# EAGLE design mbc_89_22_03_01 (EAGLE 7.6.0)

## Sheet 1 of 3
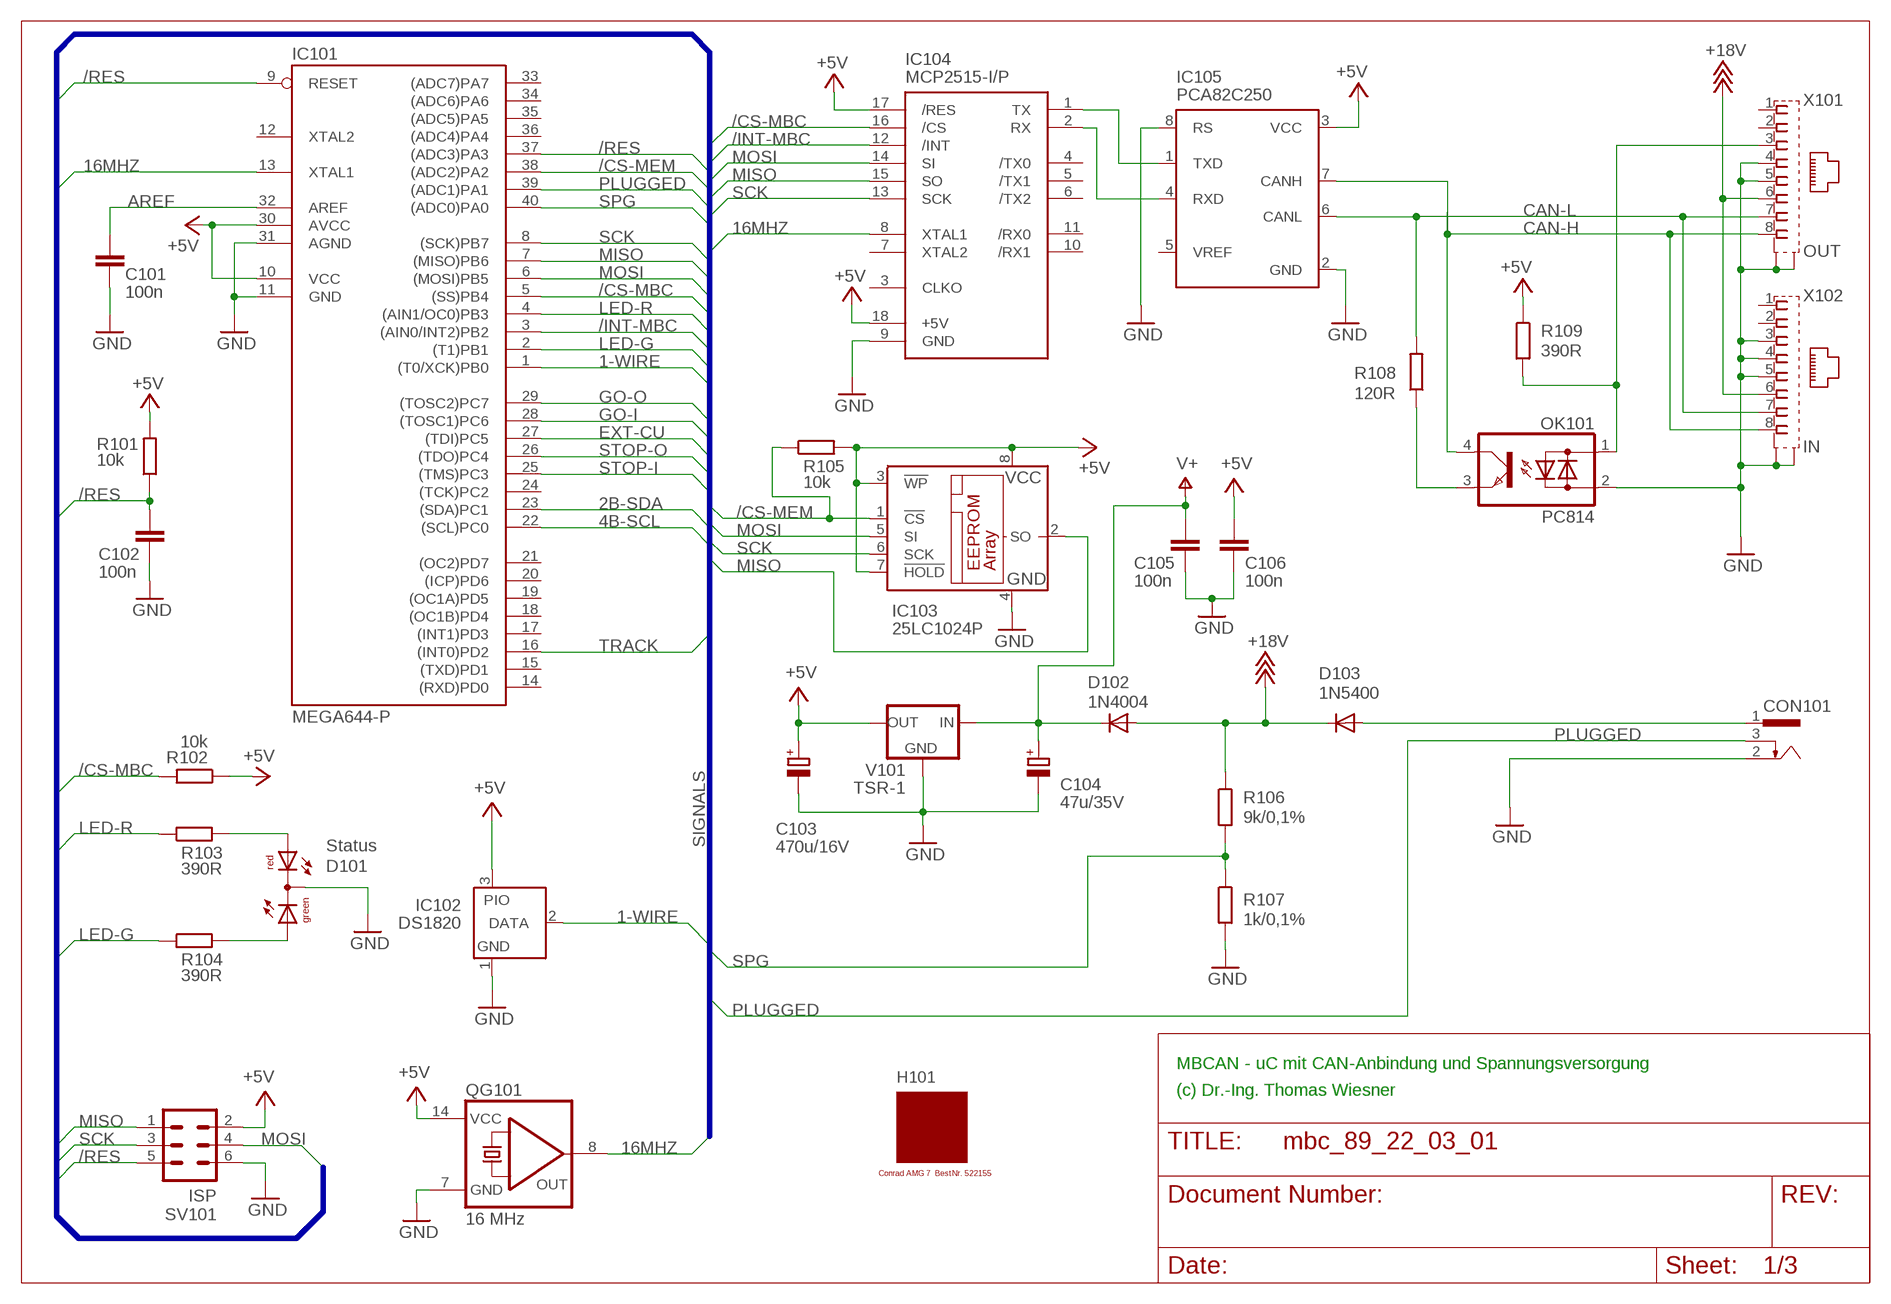
[diagram p0: schematic, sheet 1]

### Parts
C101  100n  C-EU025-025X050  [C025-025X050]
C102  100n  C-EU025-025X050  [C025-025X050]
C103  470u/16V  CPOL-EUE3.5-8  [E3,5-8]
C104  47u/35V  CPOL-EUE2.5-7  [E2,5-7]
C105  100n  C-EU025-025X050  [C025-025X050]
C106  100n  C-EU025-025X050  [C025-025X050]
CON101  POWER-JACK  [POWER-JACK]
D101  Status  DUOLED5MM  [DUOLED5MM]
D102  1N4004  [DO41-10]
D103  1N5400  [DO201-15]
H101  MODULGEHÄUSE-AMG-7  [MODULGEHÄUSE-1]
IC101  MEGA644-P  MEGA323-P  [DIL40]
IC102  DS1820  DS2405  [TO92-]
IC103  25LC1024P  25LC040P  [DIL8]
IC104  MCP2515-I/P  MCP2510-I/P  [DIL18]
IC105  PCA82C250  [DIL08]
OK101  PC814  [DIL04]
QG101  16 MHz  QG5860  [DIL14S]
R101  10k  R-EU_0207/10  [0207/10]
R102  10k  R-EU_0207/10  [0207/10]
R103  390R  R-EU_0207/10  [0207/10]
R104  390R  R-EU_0207/10  [0207/10]
R105  10k  R-EU_0207/10  [0207/10]
R106  9k/0,1%  R-EU_0207/10  [0207/10]
R107  1k/0,1%  R-EU_0207/10  [0207/10]
R108  120R  R-EU_0207/10  [0207/10]
R109  390R  R-EU_0207/10  [0207/10]
SV101  ISP  ML6  [ML6]
V101  TSR-1  [TRACO-TSR-1]
X101  OUT  0446200002  [0446200002]
X102  IN  0446200002  [0446200002]

### Nets
1-WIRE: IC101.1((T0/XCK)PB0) IC102.2(DATA)
2B-SDA: IC101.23((SDA)PC1) ; also sheet 2
4B-SCL: IC101.22((SCL)PC0) ; also sheet 2
16MHZ: IC101.13(XTAL1) IC104.8(XTAL1) QG101.8(OUT)
+5V: C103.+ C106.1 IC101.10(VCC) IC101.30(AVCC) IC102.3(PIO) IC103.3(!WP) IC103.7(!HOLD) IC103.8(VCC) IC104.17(/RES) IC104.18(+5V) IC105.3(VCC) QG101.14(VCC) R101.2 R102.1 R105.2 R109.1 SV101.2 V101.OUT ; also sheet 2
+18V: D102.A D103.C R106.1 X101.6 X102.6
/CS-MBC: IC101.5((SS)PB4) IC104.16(/CS) R102.2
/CS-MEM: IC101.38((ADC2)PA2) IC103.1(!CS) R105.1
/INT-MBC: IC101.3((AIN0/INT2)PB2) IC104.12(/INT)
/RES: C102.1 IC101.9(RESET) IC101.37((ADC3)PA3) R101.1 SV101.5
AREF: C101.1 IC101.32(AREF)
CAN-H: IC105.7(CANH) OK101.4(C) X101.8 X102.8
CAN-L: IC105.6(CANL) R108.2 X101.7 X102.7
EXT-CU: IC101.27((TDI)PC5) ; also sheet 2
GND: C101.2 C102.2 C103.- C104.- C105.2 C106.2 CON101.2 D101.K(C) IC101.11(GND) IC101.31(AGND) IC102.1(GND) IC103.4(GND) IC104.9(GND) IC105.2(GND) IC105.8(RS) OK101.2(AC2) QG101.7(GND) R107.2 SV101.6 V101.GND X101.4 X101.5 X101.S@1(S1) X101.S@2(S2) X102.3 X102.4 X102.5 X102.S@1(S1) X102.S@2(S2) ; also sheet 2
GO-I: IC101.28((TOSC1)PC6) ; also sheet 2
GO-O: IC101.29((TOSC2)PC7) ; also sheet 2
LED-G: IC101.2((T1)PB1) R104.1
LED-R: IC101.4((AIN1/OC0)PB3) R103.1
MISO: IC101.7((MISO)PB6) IC103.2(SO) IC104.15(SO) SV101.1
MOSI: IC101.6((MOSI)PB5) IC103.5(SI) IC104.14(SI) SV101.4
N$1: IC104.1(TX) IC105.1(TXD)
N$2: IC104.2(RX) IC105.4(RXD)
N$5: OK101.3(E) R108.1
N$9: D101.AR R103.2
N$11: OK101.1(AC1) R109.2 X101.3
N$13: D101.AG R104.2
PLUGGED: CON101.3 IC101.39((ADC1)PA1)
SCK: IC101.8((SCK)PB7) IC103.6(SCK) IC104.13(SCK) SV101.3
SPG: IC101.40((ADC0)PA0) R106.2 R107.1
STOP-I: IC101.25((TMS)PC3) ; also sheet 2
STOP-O: IC101.26((TDO)PC4) ; also sheet 2
TRACK: IC101.16((INT0)PD2) ; also sheet 2
V+: C104.+ C105.1 D102.C V101.IN ; also sheet 2
V-NETZTEIL: CON101.1 D103.A
Unconnected: IC101.12(XTAL2) IC101.14((RXD)PD0) IC101.15((TXD)PD1) IC101.17((INT1)PD3) IC101.18((OC1B)PD4) IC101.19((OC1A)PD5) IC101.20((ICP)PD6) IC101.21((OC2)PD7) IC101.24((TCK)PC2) IC101.33((ADC7)PA7) IC101.34((ADC6)PA6) IC101.35((ADC5)PA5) IC101.36((ADC4)PA4) IC104.3(CLKO) IC104.4(/TX0) IC104.5(/TX1) IC104.6(/TX2) IC104.7(XTAL2) IC104.10(/RX1) IC104.11(/RX0) IC105.5(VREF) X101.1 X101.2 X102.1 X102.2

### Buses
SIGNALS

### Notes on the sheet
- MBCAN - uC mit CAN-Anbindung und Spannungsversorgung
- (c) Dr.-Ing. Thomas Wiesner

## Sheet 2 of 3
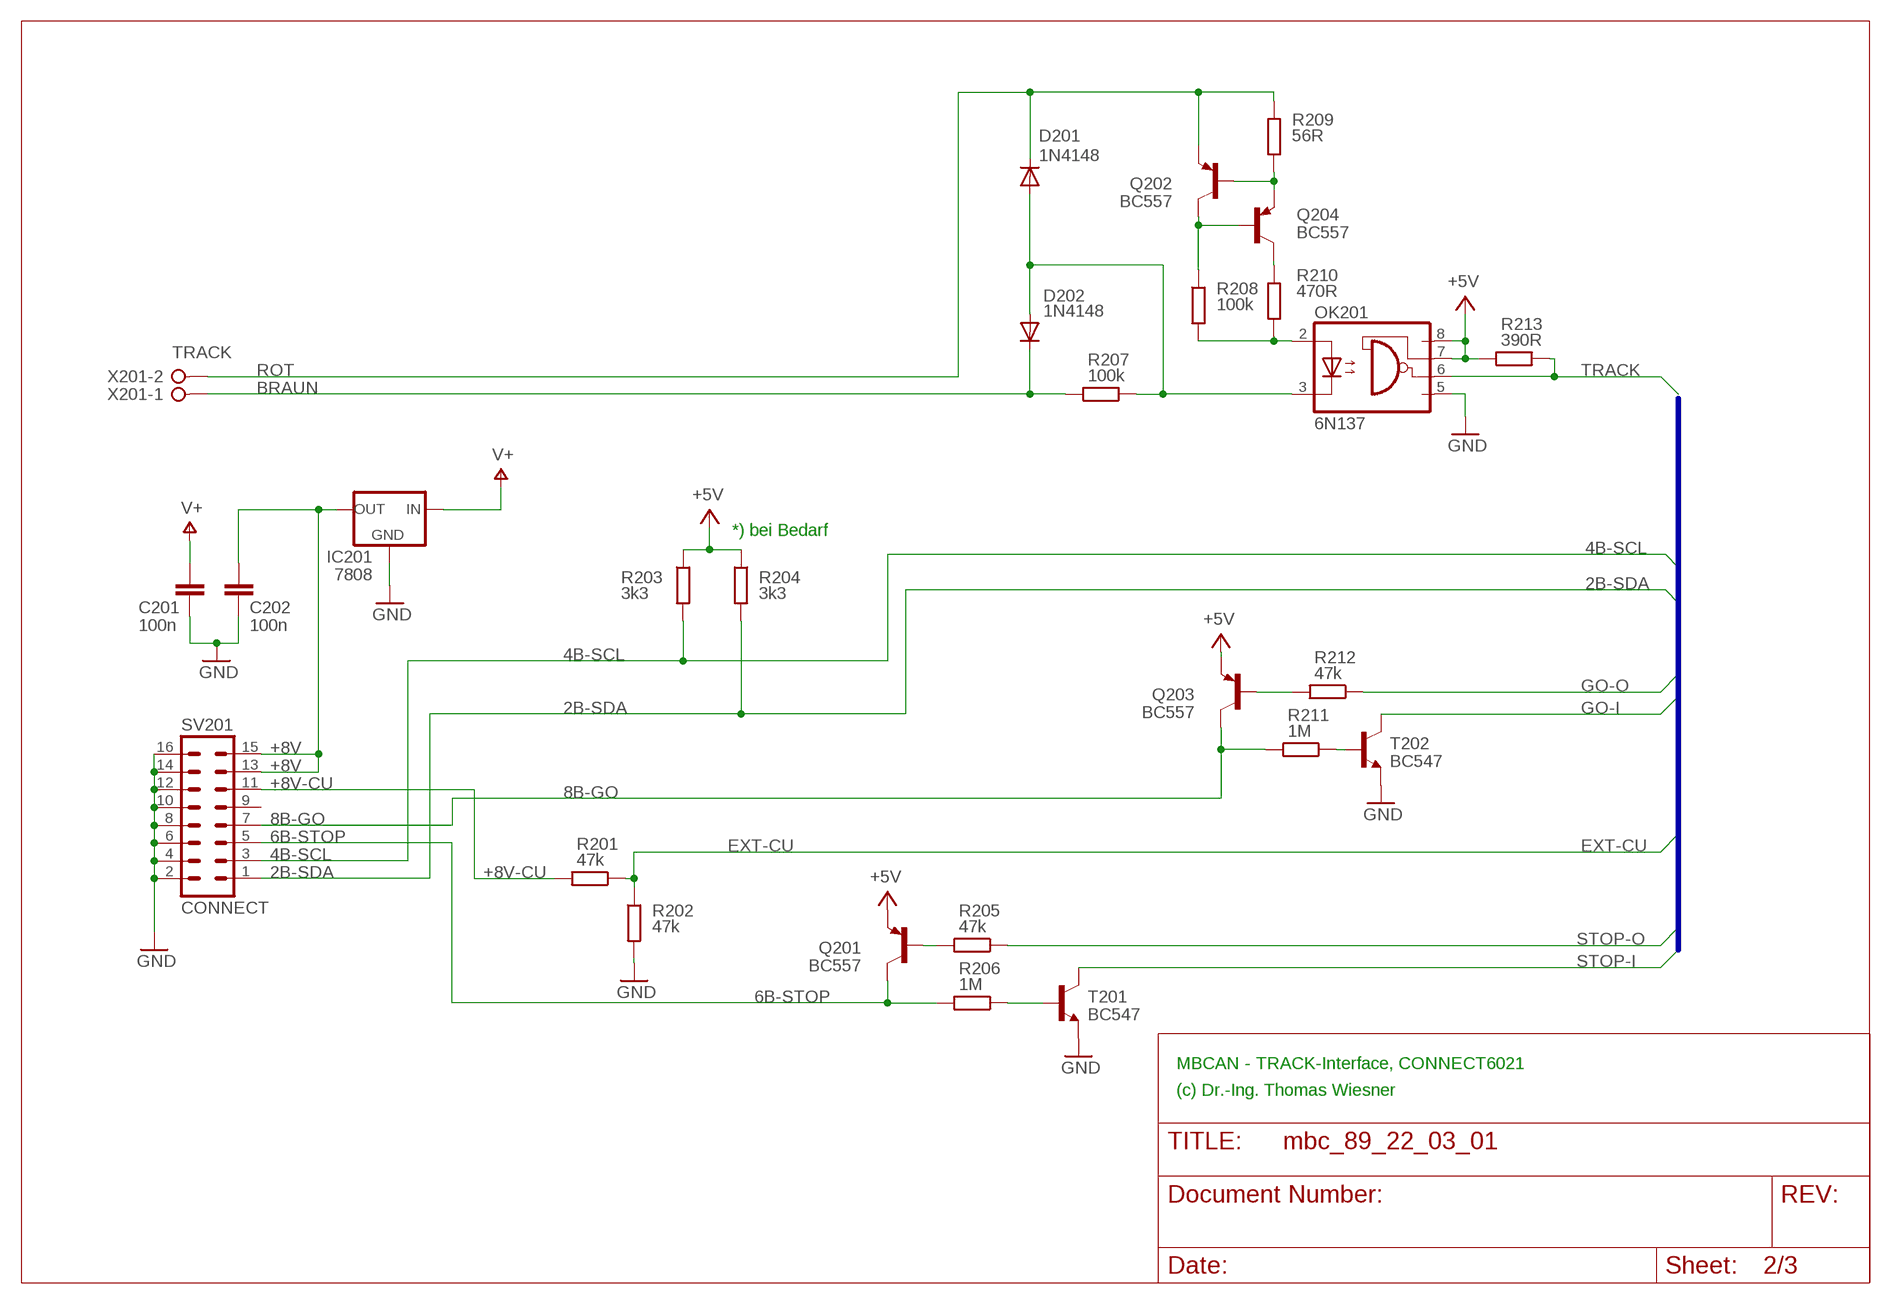
[diagram p1: schematic, sheet 2]

### Parts
C201  100n  C-EU025-025X050  [C025-025X050]
C202  100n  C-EU025-025X050  [C025-025X050]
D201  1N4148  1N4148DO35-10  [DO35-10]
D202  1N4148  1N4148DO35-10  [DO35-10]
IC201  7808  78XXL  [78XXL]
OK201  6N137  [DIL08]
Q201  BC557  [TO92]
Q202  BC557  [TO92]
Q203  BC557  [TO92]
Q204  BC557  [TO92]
R201  47k  R-EU_0207/10  [0207/10]
R202  47k  R-EU_0207/10  [0207/10]
R203  3k3  R-EU_0207/10  [0207/10]
R204  3k3  R-EU_0207/10  [0207/10]
R205  47k  R-EU_0207/10  [0207/10]
R206  1M  R-EU_0207/10  [0207/10]
R207  100k  R-EU_0207/10  [0207/10]
R208  100k  R-EU_0207/10  [0207/10]
R209  56R  R-EU_0207/10  [0207/10]
R210  470R  R-EU_0207/10  [0207/10]
R211  1M  R-EU_0207/10  [0207/10]
R212  47k  R-EU_0207/10  [0207/10]
R213  390R  R-EU_0207/10  [0207/10]
SV201  CONNECT  ML16  [ML16]
T201  BC547  [TO92]
T202  BC547  [TO92]
X201  TRACK  W237-02P  [W237-132]

### Nets
2B-SDA: R204.2 SV201.1 ; also sheet 1
4B-SCL: R203.2 SV201.3 ; also sheet 1
6B-STOP: Q201.3(C) R206.2 SV201.5
8B-GO: Q203.3(C) R211.2 SV201.7
+5V: OK201.7(VE) OK201.8(VCC) Q201.1(E) Q203.1(E) R203.1 R204.1 R213.1 ; also sheet 1
+8V: C202.1 IC201.OUT SV201.13 SV201.15
+8V-CU: R201.2 SV201.11
BRAUN: D202.C R207.2 X201.1
EXT-CU: R201.1 R202.1 ; also sheet 1
GND: C201.2 C202.2 IC201.GND OK201.5(GND) R202.2 SV201.2 SV201.4 SV201.6 SV201.8 SV201.10 SV201.12 SV201.14 SV201.16 T201.1(E) T202.1(E) ; also sheet 1
GO-I: T202.3(C) ; also sheet 1
GO-O: R212.1 ; also sheet 1
N$3: R206.1 T201.2(B)
N$4: Q201.2(B) R205.2
N$7: R211.1 T202.2(B)
N$12: Q203.2(B) R212.2
N$43: D201.A D202.A OK201.3(C) R207.1
N$53: Q202.2(B) Q204.1(E) R209.2
N$54: Q202.3(C) Q204.2(B) R208.1
N$56: Q204.3(C) R210.1
N$57: OK201.2(A) R208.2 R210.2
ROT: D201.C Q202.1(E) R209.1 X201.2
STOP-I: T201.3(C) ; also sheet 1
STOP-O: R205.1 ; also sheet 1
TRACK: OK201.6(VO) R213.2 ; also sheet 1
V+: C201.1 IC201.IN ; also sheet 1
Unconnected: SV201.9

### Buses
B$1
SIGNALS

### Notes on the sheet
- *) bei Bedarf
- MBCAN - TRACK-Interface, CONNECT6021
- (c) Dr.-Ing. Thomas Wiesner

## Sheet 3 of 3
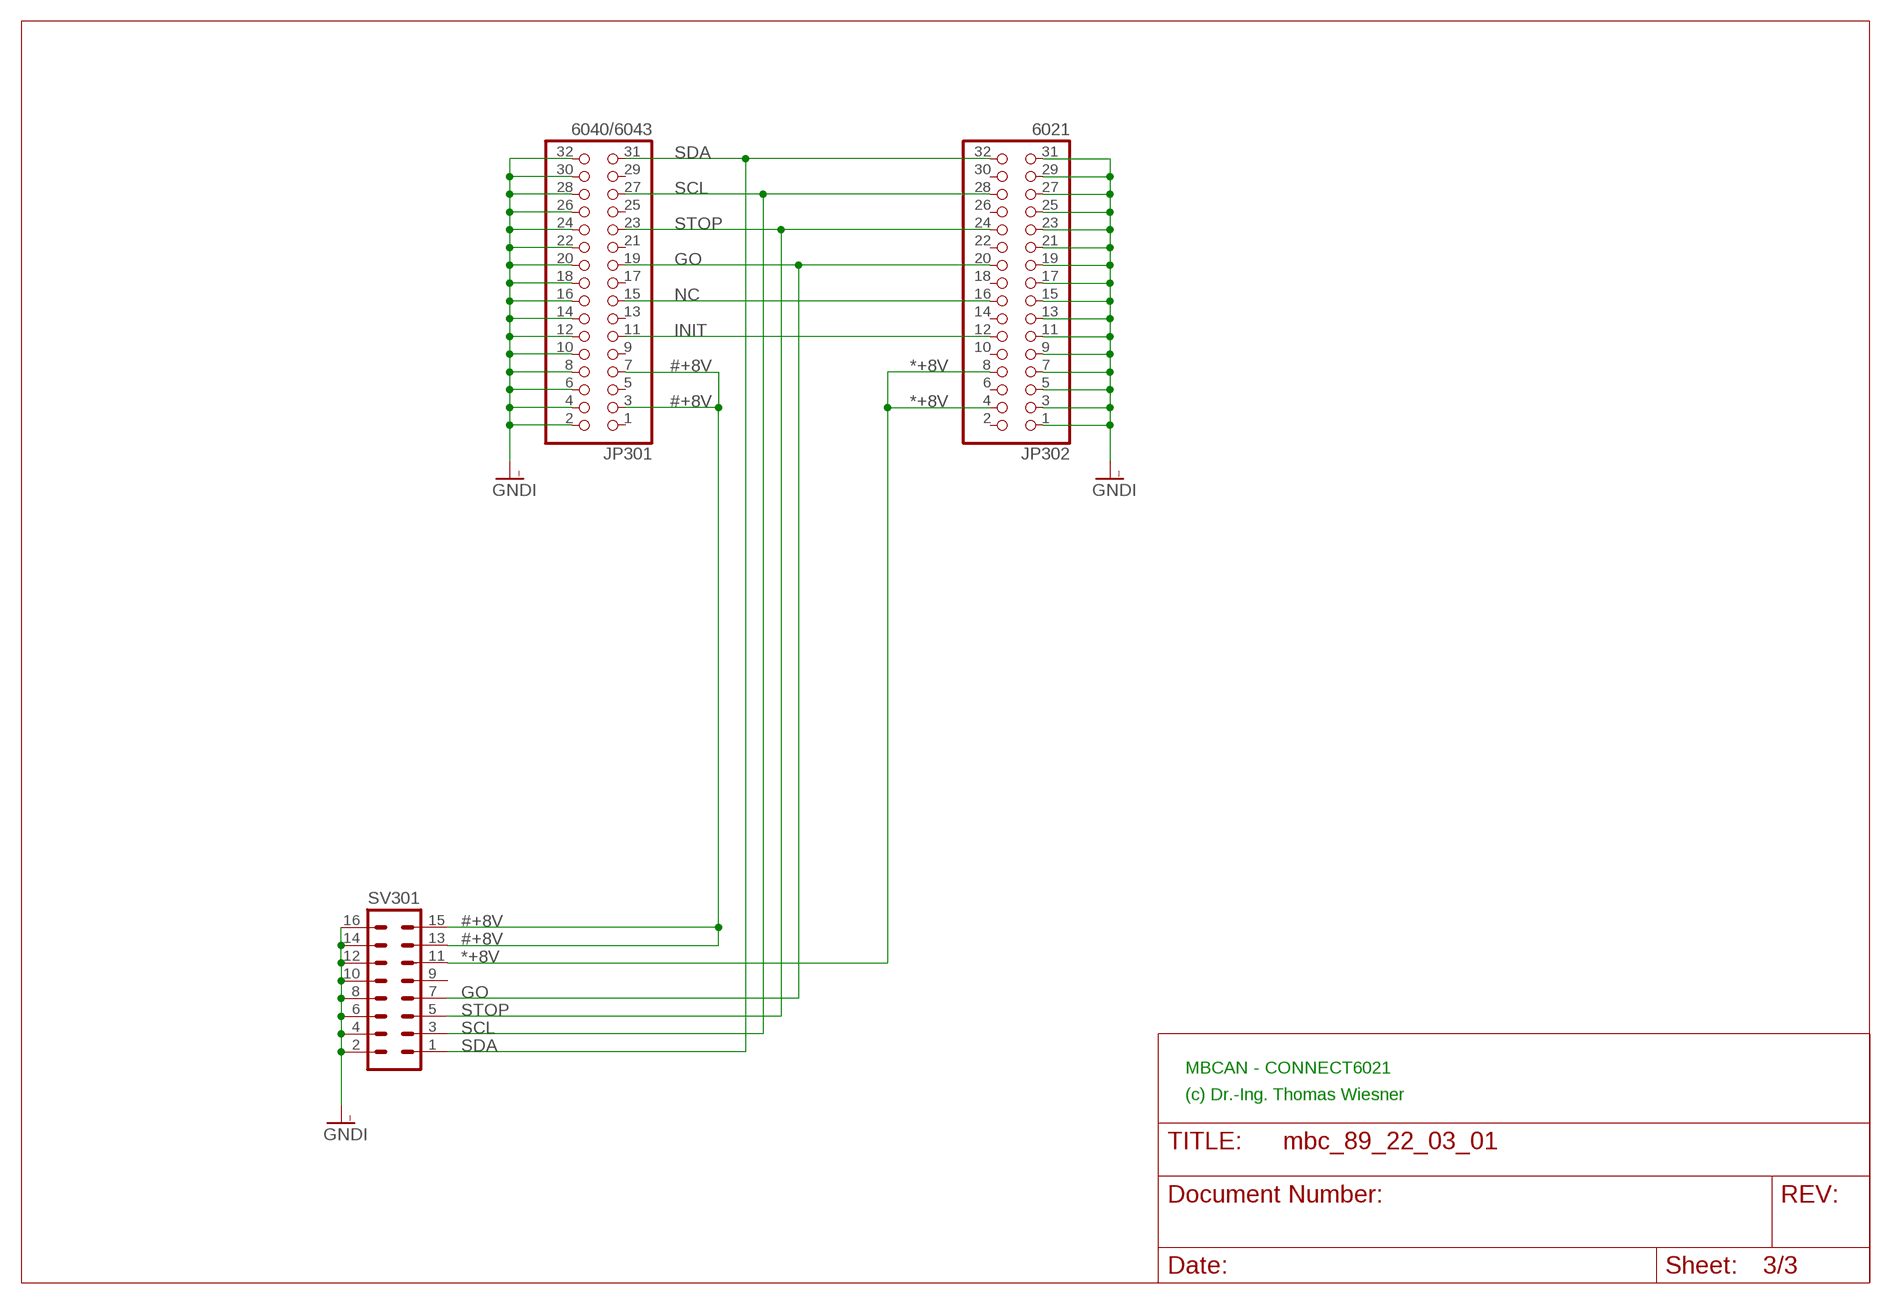
[diagram p2: schematic, sheet 3]

### Parts
JP301  6040/6043  PINHD-2X16  [2X16]
JP302  6021  PINHD-2X16  [2X16]
SV301  ML16  [ML16]

### Nets
#+8V: JP301.3 JP301.7 SV301.13 SV301.15
*+8V: JP302.4 JP302.8 SV301.11
GNDI: JP301.2 JP301.4 JP301.6 JP301.8 JP301.10 JP301.12 JP301.14 JP301.16 JP301.18 JP301.20 JP301.22 JP301.24 JP301.26 JP301.28 JP301.30 JP301.32 JP302.1 JP302.3 JP302.5 JP302.7 JP302.9 JP302.11 JP302.13 JP302.15 JP302.17 JP302.19 JP302.21 JP302.23 JP302.25 JP302.27 JP302.29 JP302.31 SV301.2 SV301.4 SV301.6 SV301.8 SV301.10 SV301.12 SV301.14 SV301.16
GO: JP301.19 JP302.20 SV301.7
INIT: JP301.11 JP302.12
NC: JP301.15 JP302.16
SCL: JP301.27 JP302.28 SV301.3
SDA: JP301.31 JP302.32 SV301.1
STOP: JP301.23 JP302.24 SV301.5
Unconnected: JP301.1 JP301.5 JP301.9 JP301.13 JP301.17 JP301.21 JP301.25 JP301.29 JP302.2 JP302.6 JP302.10 JP302.14 JP302.18 JP302.22 JP302.26 JP302.30 SV301.9

### Notes on the sheet
- MBCAN - CONNECT6021
- (c) Dr.-Ing. Thomas Wiesner

## Library data of the parts
C101 C102 C105 C106 C201 C202 = rcl:C-EU: CAPACITOR, European symbol
C103 C104 = rcl:CPOL-EU: POLARIZED CAPACITOR, European symbol
CON101 = mbc:POWER-JACK
D101 = led:DUOLED5MM: DUO LED 2 colors, 5 mm, round
D102 = diode:1N4004: DIODE general purpose rectifier, 1 A
D103 = diode:1N5400: DIODE standard rectifier, 3 A, 50 V (Motorola)
D201 D202 = diode:1N4148: DIODE high speed (Philips)
H101 = mbc:MODULGEHÄUSE-AMG-7: Gehäuse Conrad AMG 7 BestNr. 522155
IC101 = atmel:MEGA323-P: MICROCONTROLLER 32 Kbytes FLASH 2 Kbytes SRAM 1 Kbytes EEPROM USART 8-channel 10 bit ADC Source: avr.lbr; OC_FARNELL: unknown; OC_NEWARK: unknown
IC102 = maxim:DS2405: Addressable Switch DALLAS Semiconductor; MF: DALLAS SEMICONDUCTOR; MPN: DS2405; OC_FARNELL: 1188025; OC_NEWARK: 06F4645
IC103 = microchip:25*: Serial EEPROM 4K/ 8K , SPI bus; MF: MICROCHIP; MPN: 25LC040/P; OC_FARNELL: 9758100; OC_NEWARK: 96K4091
IC104 = mbc:MCP2510: BASIC-CAN 2.0a Controller Stand-alone CAN controller von Microchip
IC105 = micro-philips:PCA82C250: CAN CONTROLLER INTERFACE; OC_FARNELL: 3692358; OC_NEWARK: unknown
IC201 = v-reg:78XXL: VOLTAGE REGULATOR
JP301 JP302 = pinhead:PINHD-2X16: PIN HEADER
OK101 = optocoupler:PC814: SHARP OPTO COUPLER; OC_FARNELL: 9707662; OC_NEWARK: unknown
OK201 = optocoupler:6N137: MOTOROLA OPTO COUPLER; MPN: 6N137; OC_FARNELL: 1328376; OC_NEWARK: 52M1895
Q201-Q204 = transistor-pnp:BC557: PNP Transistor
QG101 = crystal:QG5860: CRYSTAL RESONATOR; OC_FARNELL: unknown; OC_NEWARK: unknown
R101-R109 R201-R213 = resistor:R-EU_: RESISTOR, European symbol
SV101 = con-ml:ML6: HARTING; OC_FARNELL: unknown; OC_NEWARK: unknown
SV201 SV301 = con-ml:ML16: HARTING; OC_FARNELL: unknown; OC_NEWARK: unknown
T201 T202 = transistor:BC547: NPN TRANSISTOR
V101 = mbc:TSR-1: Spannungsregler Hersteller: TRACO Typ: TSR-1 5V: TSR 1-2450 Spg: 5V Strom: 1A Reichelt TSR 1-2450
X101 X102 = mbc:0446200002: RJ-45 INVERTED MODULAR JACK ASSEMBLY WITH RJ-11 KEEPOUT FEATURE Source: Data sheet <http://www.farnell.com/datasheets/73207.pdf> MOLEX 0446200002 BUCHSE, RJ45, GESCHIRMT Source: Farnell <http://de.farnell.com/molex/0446200002/buchse-rj45-geschirmt/dp/9251910?ost=9251910>; MF: MOLEX; MPN: 0446200002; OC_FARNELL: 9251910
X201 = con-wago-508:W237-02P: WAGO SREW CLAMP; OC_FARNELL: unknown; OC_NEWARK: unknown

## Board
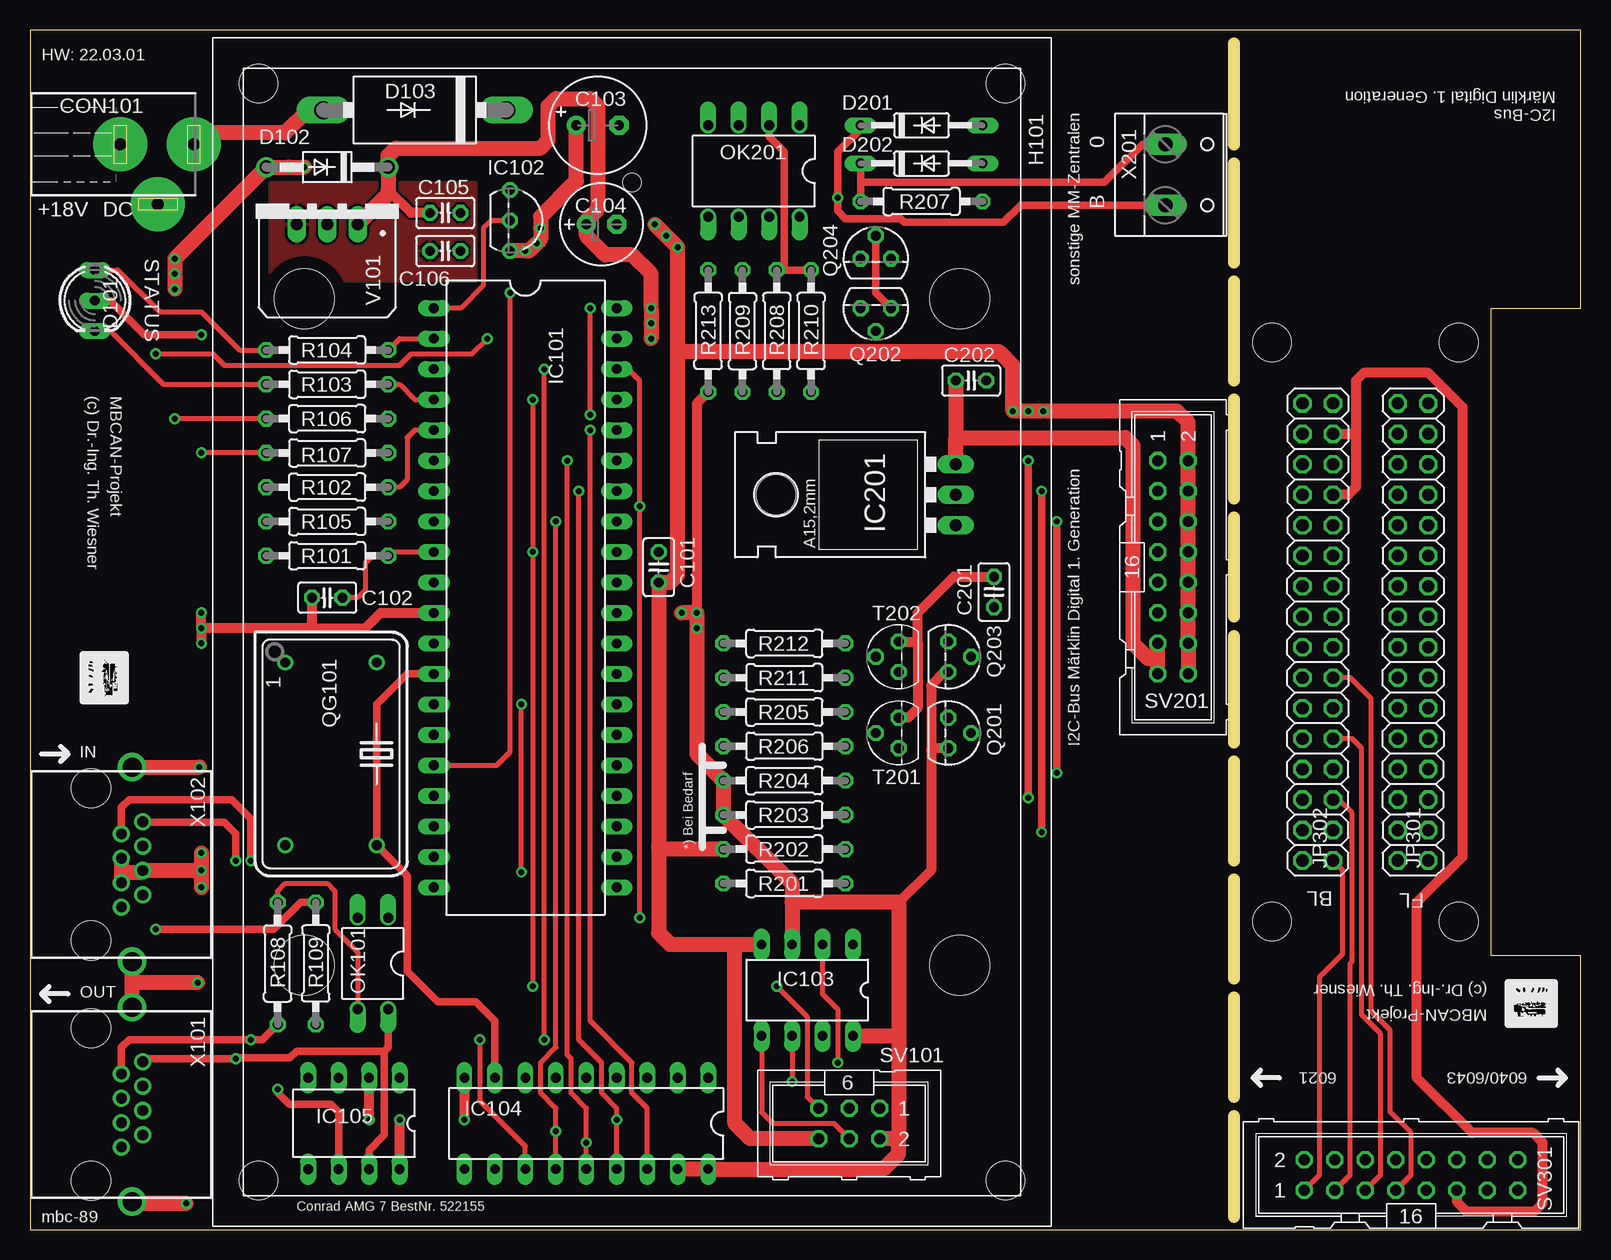
[diagram p3: board, top side]
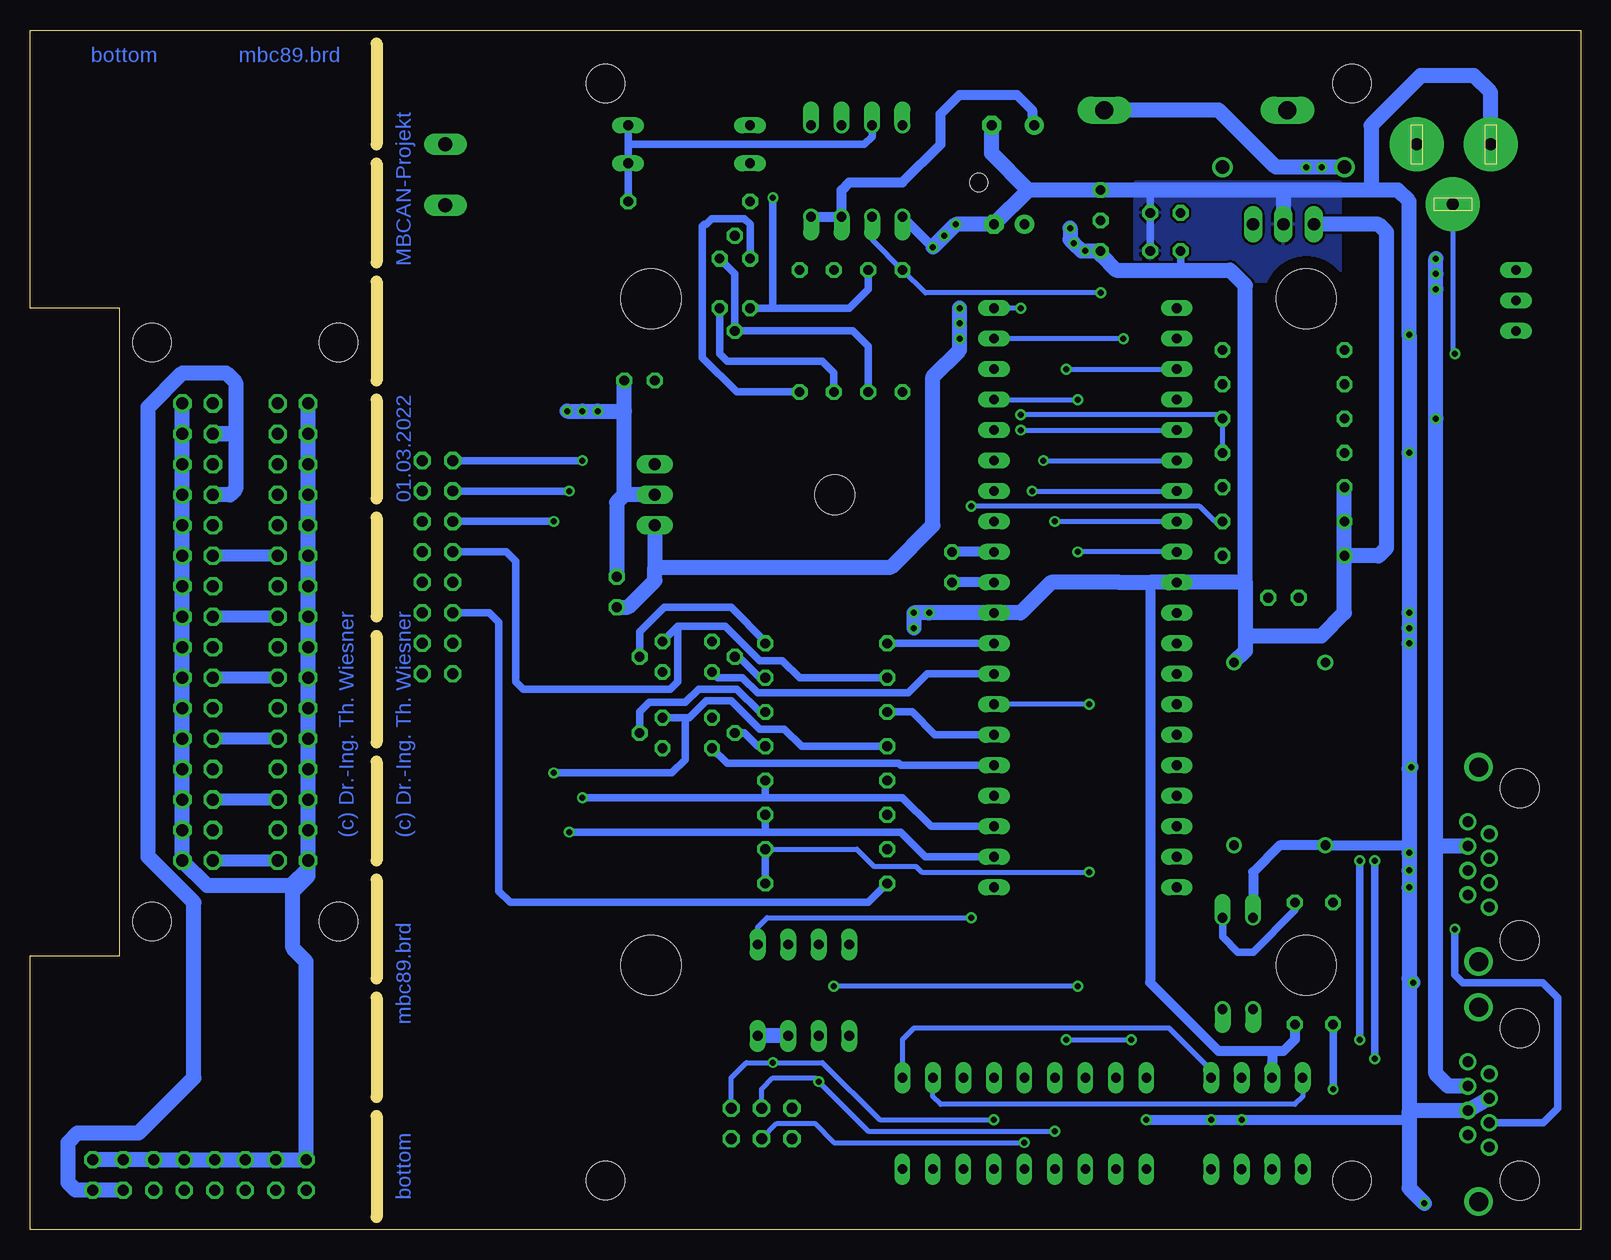
[diagram p4: board, bottom side, seen from below]

Size 129.22 x 99.99 mm. Coordinates in mm from the lower left corner, seen from the top.
Outline: 0,99.99 0,0 129.21,0 129.22,22.84 121.76,22.84 121.76,76.81 129.21,76.81 129.21,99.99 0,99.99
Copper layers (1*16): Top 0.035mm / dielectric 1.5mm / Bottom 0.035mm
Design rules "default *": minimum track width 10mil, minimum drill 0.5mm, track to track 8mil, track to pad 8mil, pad to pad 8mil, via to via 8mil, smd to smd 8mil, copper to edge 40mil, drill to drill 8mil, minimum pad ring 10mil, minimum via ring 8mil, stop-mask expansion 4mil, vias tented up to drill 0mil, thermal gap 10mil
Holes 3.2 mm at 103.5,25.7 103.5,73.96 119.06,73.96 119.06,25.7
Milling: 10 lines

### Footprints (pad centres in the part's own frame; a part is rotated, then mirrored left to right if it is on the bottom)
C025-025X050 = drill 0.813 octagon: 1 -1.27,0; 2 1.27,0
E3,5-8 = drill 0.813 pad 1.6: + -1.778,0 | drill 0.813 pad 1.6 octagon: - 1.778,0
E2,5-7 = drill 0.813 pad 1.6: + -1.27,0 | drill 0.813 pad 1.6 octagon: - 1.27,0
POWER-JACK = drill 1 pad 4.5: 1 0,6.03; 2 0,-0.12; 3 5,3.03
DUOLED5MM = drill 0.813 long: AG -2.54,0; AR 2.54,0; K 0,0
DO41-10 = drill 1.118: A 5.08,0; C -5.08,0
DO201-15 = drill 1.499 long: A 7.62,0; C -7.62,0
DO35-10 = drill 0.813 long: A 5.08,0; C -5.08,0
MODULGEHÄUSE-1 = hole 3.2: -45.72,-31.115; -45.72,31.115; 45.72,31.115; 45.72,-31.115 | hole 5: -27.781,-27.305; 27.781,-27.305; -27.781,27.305; 27.781,27.305 | hole 1.5: -37.465,0
DIL40 = drill 0.813 long: 1 -24.13,-7.62; 2 -21.59,-7.62; 3 -19.05,-7.62; 4 -16.51,-7.62; 5 -13.97,-7.62; 6 -11.43,-7.62; 7 -8.89,-7.62; 8 -6.35,-7.62; 9 -3.81,-7.62; 10 -1.27,-7.62; 11 1.27,-7.62; 12 3.81,-7.62; 13 6.35,-7.62; 14 8.89,-7.62; 15 11.43,-7.62; 16 13.97,-7.62; 17 16.51,-7.62; 18 19.05,-7.62; 19 21.59,-7.62; 20 24.13,-7.62; 21 24.13,7.62; 22 21.59,7.62; 23 19.05,7.62; 24 16.51,7.62; 25 13.97,7.62; 26 11.43,7.62; 27 8.89,7.62; 28 6.35,7.62; 29 3.81,7.62; 30 1.27,7.62; 31 -1.27,7.62; 32 -3.81,7.62; 33 -6.35,7.62; 34 -8.89,7.62; 35 -11.43,7.62; 36 -13.97,7.62; 37 -16.51,7.62; 38 -19.05,7.62; 39 -21.59,7.62; 40 -24.13,7.62
TO92- = drill 0.813 octagon: 1 -2.54,0; 2 0,0; 3 2.54,0
DIL8 = drill 0.813 long: 1 -3.81,-3.81; 2 -1.27,-3.81; 3 1.27,-3.81; 4 3.81,-3.81; 5 3.81,3.81; 6 1.27,3.81; 7 -1.27,3.81; 8 -3.81,3.81
DIL18 = drill 0.813 long: 1 -10.16,-3.81; 2 -7.62,-3.81; 3 -5.08,-3.81; 4 -2.54,-3.81 | drill 0.8 long: 5 0,-3.81; 6 2.54,-3.81; 7 5.08,-3.81; 8 7.62,-3.81; 9 10.16,-3.81; 10 10.16,3.81; 11 7.62,3.81; 12 5.08,3.81; 13 2.54,3.81; 14 0,3.81; 15 -2.54,3.81; 16 -5.08,3.81; 17 -7.62,3.81; 18 -10.16,3.81
DIL08 = drill 0.813 long: 1 -3.81,-3.81; 2 -1.27,-3.81; 3 1.27,-3.81; 4 3.81,-3.81; 5 3.81,3.81; 6 1.27,3.81; 7 -1.27,3.81; 8 -3.81,3.81
78XXL = drill 1.016 long: GND 0,-3.81; IN -2.54,-3.81; OUT 2.54,-3.81 | hole 3.302: 0,11.176
2X16 = drill 1.016 octagon: 1 -19.05,-1.27; 2 -19.05,1.27; 3 -16.51,-1.27; 4 -16.51,1.27; 5 -13.97,-1.27; 6 -13.97,1.27; 7 -11.43,-1.27; 8 -11.43,1.27; 9 -8.89,-1.27; 10 -8.89,1.27; 11 -6.35,-1.27; 12 -6.35,1.27; 13 -3.81,-1.27; 14 -3.81,1.27; 15 -1.27,-1.27; 16 -1.27,1.27; 17 1.27,-1.27; 18 1.27,1.27; 19 3.81,-1.27; 20 3.81,1.27; 21 6.35,-1.27; 22 6.35,1.27; 23 8.89,-1.27; 24 8.89,1.27; 25 11.43,-1.27; 26 11.43,1.27; 27 13.97,-1.27; 28 13.97,1.27; 29 16.51,-1.27; 30 16.51,1.27; 31 19.05,-1.27; 32 19.05,1.27
DIL04 = drill 0.813 offset: 1 -1.27,-3.81; 2 1.27,-3.81; 3 1.27,3.81; 4 -1.27,3.81
DIL08' = drill 0.813 offset: 1 -3.81,-3.81; 2 -1.27,-3.81; 3 1.27,-3.81; 4 3.81,-3.81; 5 3.81,3.81; 6 1.27,3.81; 7 -1.27,3.81; 8 -3.81,3.81
TO92 = drill 0.813 octagon: 1 1.27,0; 2 0,1.905; 3 -1.27,0
DIL14S = drill 0.813: 1 -7.62,-3.81; 7 7.62,-3.81; 8 7.62,3.81; 14 -7.62,3.81
0207/10 = drill 0.813 octagon: 1 -5.08,0; 2 5.08,0
ML6 = drill 0.914 octagon: 1 -2.54,-1.27; 2 -2.54,1.27; 3 0,-1.27; 4 0,1.27; 5 2.54,-1.27; 6 2.54,1.27
ML16 = drill 0.914 octagon: 1 -8.89,-1.27; 2 -8.89,1.27; 3 -6.35,-1.27; 4 -6.35,1.27; 5 -3.81,-1.27; 6 -3.81,1.27; 7 -1.27,-1.27; 8 -1.27,1.27; 9 1.27,-1.27; 10 1.27,1.27; 11 3.81,-1.27; 12 3.81,1.27; 13 6.35,-1.27; 14 6.35,1.27; 15 8.89,-1.27; 16 8.89,1.27
TRACO-TSR-1 = drill 1.016 long: GND 0,2.54; IN -2.54,2.54; OUT 2.54,2.54
0446200002 = drill 0.889 pad 1.422: 1 3.556,2.54; 2 2.54,4.318; 3 1.524,2.54; 4 0.508,4.318; 5 -0.508,2.54; 6 -1.524,4.318; 7 -2.54,2.54; 8 -3.556,4.318 | drill 1.575 pad 2.286: S@1 -8.103,3.429; S@2 8.103,3.429 | hole 3.251: 6.35,0; -6.35,0
W237-132 = drill 1.194 long: 1 -2.54,-0.635; 2 2.54,-0.635

### Placement (x,y rotation side)
C101  52.39,55.22 270 top
C102  24.77,52.68 180 top
C103  47.31,92.06 0 top
C104  47.62,83.8 0 top
C105  34.61,84.75 0 top
C106  34.61,81.58 0 top
C201  80.33,53.16 90 top
C202  78.42,70.78 0 top
CON101  7.62,90.47 270 top
D101  5.4,77.45 270 top
D102  24.77,88.56 180 top
D103  32.07,93.33 180 top
D201  74.3,92.06 0 top
D202  74.3,88.88 0 top
H101  50.16,49.83 270 top
IC101  41.27,52.68 270 top
IC102  40.01,84.12 270 top
IC103  64.77,19.98 180 top
IC104  46.35,8.87 180 top
IC105  26.99,8.87 180 top
IC201  73.34,61.26 90 top
JP301  115.25,49.83 270 top
JP302  107.31,49.83 270 top
OK101  28.57,22.21 180 top
OK201  6N137  [DIL08']  60.33,88.25 180 top
Q201  76.52,41.41 270 top
Q202  70.48,76.81 180 top
Q203  76.52,47.76 270 top
Q204  70.48,80.94 0 top
QG101  25.08,39.67 270 top
R101  24.77,56.18 180 top
R102  24.77,61.89 0 top
R103  24.77,70.47 180 top
R104  24.77,73.32 180 top
R105  24.77,59.03 180 top
R106  24.77,67.61 0 top
R107  24.77,64.75 180 top
R108  20.64,22.21 270 top
R109  23.81,22.21 90 top
R201  62.87,28.87 180 top
R202  62.87,31.73 180 top
R203  62.87,34.59 0 top
R204  62.87,37.45 0 top
R205  62.87,43.16 0 top
R206  62.87,40.3 180 top
R207  74.3,85.7 180 top
R208  62.23,74.91 90 top
R209  59.37,74.91 270 top
R210  65.09,74.91 90 top
R211  62.87,46.02 180 top
R212  62.87,48.88 0 top
R213  56.52,74.91 90 top
SV101  68.26,8.87 180 top
SV201  95.25,55.22 270 top
SV301  115.09,4.58 0 top
T201  72.39,41.41 90 top
T202  72.39,47.76 90 top
V101  24.77,86.34 180 top
X101  5.08,10.46 270 top
X102  5.08,30.46 270 top
X201  95.25,87.93 270 top

### Tracks (layer width: path | path; a pad name or v marks a point on that pad's centre or on a via)
1-WIRE
  Top 0.406: IC101.1 35.88,76.81 37.78,78.72 37.78,83.48 38.42,84.12 IC102.2
2B-SDA  (via drill 0.5)
  Top 0.61: v83.19,64.12 v83.19,36.02
  Bottom 0.61: SV201.1 v83.19,64.12 | v83.19,36.02 67.94,36.02 | 67.94,36.02 56.52,36.02 54.13,33.63 IC101.23 | R204.2 67.94,36.02
4B-SCL  (via drill 0.5)
  Top 0.61: v84.3,61.57 v84.3,33.16
  Bottom 0.61: SV201.3 v84.3,61.57 | v84.3,33.16 67.94,33.16 | 67.94,33.16 56.67,33.16 54.61,31.09 IC101.22 | R203.2 67.94,33.16
6B-STOP  (via drill 0.5)
  Top 0.61: v85.57,59.03 v85.57,38.08
  Bottom 0.61: R206.2 64.93,40.3 66.36,41.73 68.42,41.73 70.8,44.11 72.87,44.11 74.3,42.68 74.61,42.68 | SV201.5 v85.57,59.03 | v85.57,38.08 75.72,38.08 74.61,39.19 74.61,42.68 | 74.61,42.68 Q201.3
8B-GO
  Bottom 0.61: R211.2 65.09,46.02 66.52,47.45 68.42,47.45 71.28,50.3 75.25,50.3 | Q203.3 75.25,50.3 | 75.25,50.3 75.25,45.7 75.88,45.06 88.11,45.06 88.74,45.7 88.74,55.7 89.53,56.49 SV201.7
16MHZ
  Top 0.61: IC104.8 38.73,17.44 37.15,19.03 33.97,19.03 31.43,21.57 31.43,29.51 QG101.8 28.89,43.79 31.43,46.33 IC101.13
#+8V
  Bottom 0.813: SV301.15 SV301.13
  Bottom 1.27: SV301.13 125.41,3.31 126.05,3.95 126.05,7.28 125.25,8.08 120.17,8.08 115.57,12.68 115.57,27.29 119.38,31.09 119.38,68.56 116.52,71.42 112.87,71.42 112.08,70.62 112.08,66.5 | 112.08,66.5 112.08,66.34 | 112.08,66.34 JP301.3 112.24,66.34 112.08,66.5 | 112.08,66.34 112.08,61.73 112.55,61.26 JP301.7
*+8V
  Top 0.61: 110.49,66.34 110.01,66.34
  Top 0.813: JP302.4 110.01,66.34 | JP302.8 109.86,61.26 110.49,61.89 110.49,66.34 110.49,70.78 111.12,71.42 116.52,71.42 119.38,68.56 119.38,31.09 115.57,27.29 115.57,12.68 120.17,8.08 125.25,8.08 126.05,7.28 126.05,2.2 125.41,1.57 119.7,1.57 118.9,2.36 SV301.11
+5V  (via drill 0.5)
  Top 0.813: R213.1 55.56,68.88 v55.56,51.41 | Q203.1 76.2,46.49 75.09,45.38 75.09,39.98 | 75.09,39.98 75.09,29.98 72.39,27.29 | Q201.1 75.41,40.14 75.09,39.98
  Top 1.27: C103.+ 45.53,87.42 42.55,84.44 v42.55,83.48 42.55,82.53 v42.23,82.21 41.59,81.58 v41.27,81.58 IC102.3 | IC104.17 IC104.18 71.12,5.06 72.39,6.33 72.39,7.6 | IC103.8 72.39,16.17 | 72.39,16.17 72.39,7.6 | 72.39,7.6 SV101.2 | 72.39,16.17 72.39,27.29 63.5,27.29 | 63.5,27.29 IC103.3 | v54.29,51.41 v55.56,51.41 v55.56,50.14 55.56,39.67 R204.1 R203.1 63.5,28.87 63.5,27.29
  Bottom 0.406: 15.88,69.51 16.19,56.81
  Bottom 0.61: C106.1 33.34,79.99
  Bottom 0.813: 27.62,49.51 26.67,49.51 | 35.88,53.95 35.88,20.62 30.16,14.9 25.72,14.9 | R109.1 23.81,15.86 24.77,14.9 25.72,14.9 | 25.72,14.9 IC105.3 25.72,13.95 | OK201.8 OK201.7 61.59,86.66 60.96,87.29 56.52,87.29 53.34,90.47 53.34,93.01 51.75,94.59 46.99,94.59 45.72,93.33 45.72,92.25 C103.+
  Bottom 1.27: 27.94,53.95 IC101.10 35.88,53.95 37.15,53.95 38.42,53.95 44.13,53.95 46.67,51.41 IC101.30 v54.29,51.41 v55.56,51.41 v55.56,50.14 | R101.2 19.68,51.41 21.59,49.51 26.67,49.51 27.94,49.51 | 27.94,53.95 27.94,78.72 29.21,79.99 33.34,79.99 38.73,79.99 40.01,81.26 IC102.3 41.59,81.58 v42.23,82.21 42.55,82.53 v42.55,83.48 | 27.94,53.95 27.94,49.51 | V101.OUT 16.83,83.8 16.19,83.17 16.19,56.81 16.83,56.18 R101.2 | IC103.7 IC103.8 | R101.2 R105.2 R102.1 | 27.94,49.51 27.94,48.24 QG101.14
  pour Top: 37.15,87.29 37.15,79.04 20,79.04 20,87.29
+8V
  Top 0.813: 93.98,47.6 SV201.15
  Top 1.016: 93.19,47.6 93.98,47.6
  Top 1.27: C202.1 77.15,66.02 | IC201.OUT 77.15,64.59 77.15,65.23 77.15,66.02 | 77.15,66.02 91.28,66.02 91.92,65.39 91.92,48.88 93.19,47.6 | SV201.15 SV201.13
+8V-CU
  Bottom 0.61: R201.2 59.37,27.29 89.22,27.29 90.17,28.24 90.17,50.62 90.96,51.41 SV201.11
+18V  (via drill 0.5)
  Top 0.406: R106.1 v12.06,67.61
  Top 1.27: v12.06,78.4 v12.06,79.67 v12.06,80.94 D102.A v21.59,88.56 v22.86,88.56
  Bottom 1.27: D103.C 30.16,93.33 25.4,88.56 v22.86,88.56 v21.59,88.56 D102.A | X101.6 11.05,11.98 12.06,13 12.06,32.05 | 12.06,32.05 v12.06,67.61 v12.06,78.4 v12.06,79.67 v12.06,80.94 | X102.6 12,31.98 12.06,32.05
/CS-MBC  (via drill 0.5)
  Top 0.406: IC104.16 51.44,10.14 50.16,11.41 50.16,13.95 46.67,17.44 v46.67,66.66 | IC101.5 32.07,66.66 31.43,66.02 31.43,62.53 30.8,61.89 R102.2
  Bottom 0.406: v46.67,66.66 IC101.5
/CS-MEM  (via drill 0.5)
  Top 0.406: v50.8,26.02 v50.8,60.3 50.8,70.78 49.85,71.73 IC101.38
  Bottom 0.406: IC103.1 68.58,25.22 67.79,26.02 v50.8,26.02 | R105.1 30.48,59.03 31.75,60.3 v50.8,60.3
/INT-MBC  (via drill 0.5)
  Top 0.406: IC104.12 41.27,6.97 37.47,10.78 v37.47,15.86 | v42.86,15.86 v42.86,71.73
  Bottom 0.406: v42.86,71.73 IC101.3 | v42.86,15.86 v37.47,15.86
/RES  (via drill 0.5)
  Top 0.406: IC101.9 30.16,56.49 R101.1 28.57,56.18 27.94,55.54 27.94,53.32 27.3,52.68 C102.1 | v41.91,20.3 v41.91,56.49 v41.91,69.2 | v62.23,20.3 64.77,17.76 64.77,11.09 SV101.5
  Bottom 0.406: IC101.9 v41.91,56.49 | v41.91,20.3 v62.23,20.3 | IC101.37 v41.91,69.2
AREF
  Bottom 0.813: IC101.32 C101.1
BRAUN
  Top 0.61: R207.2 D202.C 69.22,87.29 89.53,87.29 92.71,90.47 X201.1
CAN-H  (via drill 0.5)
  Top 0.61: OK101.4 29.84,15.22 29.53,14.9 | 29.53,14.9 29.53,7.92 28.26,6.65 IC105.7 | 29.53,14.9 22.23,14.9 21.65,14.33 17.14,14.33 v17.14,14.27 9.4,14.27 X101.8 | X102.8 9.4,33.95 16.19,33.95 17.14,33 v17.14,30.78
  Bottom 0.61: v17.14,30.78 v17.14,14.27
CAN-L  (via drill 0.5)
  Top 0.61: IC105.6 25.72,9.82 25.08,10.46 21.59,10.46 20.64,11.41 v20.64,11.73 | R108.2 19.37,15.86 v18.41,15.86 8.26,15.86 7.62,15.22 X101.7 | v18.41,30.78 18.41,34.27 16.83,35.86 8.26,35.86 7.62,35.22 X102.7
  Bottom 0.61: v20.64,11.73 R108.2 | v18.41,30.78 v18.41,15.86
EXT-CU  (via drill 0.5)
  Top 0.406: v40.96,29.82 v40.96,43.79
  Bottom 0.406: R202.1 60.33,31.73 58.9,30.3 55.4,30.3 54.93,29.82 v40.96,29.82 | v40.96,43.79 IC101.27
  Bottom 0.61: R201.1 R202.1
GND  (via drill 0.5)
  Top 0.406: R107.2 v14.29,64.75
  Top 0.61: D101.K 6.67,77.45 9.53,74.59 v14.29,74.59
  Top 0.813: 23.5,50.14 27.94,50.14 29.21,51.41 IC101.11 | C102.2 23.5,50.14 | IC105.8 v30.8,9.19 | v28.26,9.19 IC105.2 | IC104.9 v36.2,9.19 | 23.5,50.14 v14.29,50.14 | v14.29,50.14 v14.29,51.41 | v14.29,50.14 v14.29,48.88 | SV201.10 SV201.8 | 73.98,49.03 73.98,43.48 73.18,42.68 T201.1 | T202.1 73.98,49.03 | 73.98,49.03 73.98,51.41 76.99,54.43 C201.2
  Top 1.27: SV101.6 60.01,7.6 58.74,8.87 58.74,23.79 | 58.74,23.79 IC103.4 | 58.74,23.79 53.34,23.79 52.39,24.75 52.39,31.89 | 52.39,31.89 C101.2 53.34,53.95 53.98,54.59 53.98,73.16 | 53.98,73.16 v53.98,81.9 v53.02,82.85 v52.07,83.8 | 7.62,29.82 X102.3 | X102.5 7.62,29.82 | 7.62,29.82 9.4,29.82 X102.4 v14.29,29.95 | X101.S@2 8.51,2.2 v13.02,2.2 | X101.S@1 8.51,20.62 | 8.51,20.62 X102.S@2 | v13.97,20.62 8.51,20.62 | X102.S@1 v14.12,38.56 | v14.29,31.41 v14.29,28.55 | SV201.8 SV201.6 SV201.4 SV201.2 | 53.98,73.16 80.8,73.16 81.92,72.05 v81.92,68.24 v83.19,68.24 v84.45,68.24 95.57,68.24 96.52,67.29 SV201.10 SV201.12 SV201.14 SV201.16 | R202.2 52.55,31.73 52.39,31.89
  Bottom 0.61: 36.2,86.66 35.88,86.66 C105.2 C106.2
  Bottom 0.813: IC101.31 C101.2 | v36.2,9.19 v30.8,9.19 v28.26,9.19 14.29,9.19 14.29,9.82 | 14.29,31.73 14.29,32.05 QG101.7 25.08,32.05 27.3,29.82 OK101.2 | OK201.5 v53.98,81.9
  Bottom 1.016: 79.69,68.24 C202.2
  Bottom 1.27: 17.78,86.66 15.24,86.66 14.29,85.7 v14.29,74.59 v14.29,64.75 v14.29,51.41 v14.29,50.14 v14.29,48.88 14.29,38.4 | 17.78,86.66 24.77,86.66 | 24.77,86.66 36.2,86.66 IC102.1 46.04,86.66 | 46.04,86.66 C104.- v52.07,83.8 v53.02,82.85 v53.98,81.9 | C103.- 49.09,89.7 46.04,86.66 | 24.77,86.66 V101.GND | 14.29,38.4 14.29,31.73 v14.29,31.41 v14.29,29.95 v14.29,28.55 14.29,20.93 | 14.29,20.93 14.29,9.82 14.29,9.51 | 14.29,9.51 14.29,9.19 14.29,3.47 v13.02,2.2 | v14.12,38.56 14.29,38.4 | v13.97,20.62 14.29,20.93 | 14.29,9.51 13.84,9.95 X101.4 X101.5 | CON101.2 7.5,94.79 8.89,96.18 13.34,96.18 17.46,92.06 17.46,86.98 17.78,86.66 | IC201.GND 79.69,61.26 | 79.69,61.26 C202.2 | v84.45,68.24 v83.19,68.24 v81.92,68.24 79.69,68.24 | 79.69,61.26 80.33,60.62 C201.2
  pour Bottom: 37.15,87.29 37.15,79.04 20,79.04 20,87.29
GNDI
  Bottom 1.016: 106.05,30.14 JP302.31
  Bottom 1.27: JP301.2 JP301.4 JP301.6 JP301.8 JP301.10 JP301.12 JP301.14 JP301.16 JP301.18 JP301.20 JP301.22 JP301.24 JP301.26 JP301.28 JP301.30 JP301.32 114.46,28.71 107.47,28.71 106.05,30.14 | JP302.1 JP302.3 JP302.5 JP302.7 JP302.9 JP302.11 JP302.13 JP302.15 JP302.17 JP302.19 JP302.21 JP302.23 JP302.25 JP302.27 JP302.29 JP302.31 106.05,29.51 107.31,28.24 107.31,23.48 106.2,22.36 SV301.2 SV301.4 SV301.6 SV301.8 SV301.10 SV301.12 SV301.14 SV301.16
GO
  Top 0.406: SV301.7 115.09,4.58 115.09,8.08 113.35,9.82 113.35,16.65 111.76,18.24 111.76,44.27 110.01,46.02 JP302.20
  Bottom 1.016: JP302.20 JP301.19
GO-I
  Bottom 0.61: IC101.28 54.45,46.33 56.04,44.75 68.58,44.75 69.85,46.02 71.91,46.02 T202.3
GO-O
  Bottom 0.61: IC101.29 R212.1
INIT
  Bottom 1.016: JP302.12 JP301.11
LED-G
  Top 0.406: R104.1 30.8,74.28 IC101.2
LED-R
  Top 0.406: R103.1 30.8,70.47 32.07,69.2 IC101.4
MISO  (via drill 0.5)
  Top 0.406: IC104.15 v48.9,9.19 48.9,10.14 47.62,11.41 47.62,13.95 45.72,15.86 v45.72,61.57 | IC103.2 66.04,19.66 67.31,18.39 v67.31,13.95
  Bottom 0.406: v45.72,61.57 IC101.7 | SV101.1 70.8,12.68 69.53,13.95 v67.31,13.95 63.18,13.95 58.42,9.19 v48.9,9.19
MOSI  (via drill 0.5)
  Top 0.406: IC104.14 v46.35,7.28 46.35,10.14 45.09,11.41 45.09,14.27 44.77,14.59 v44.77,64.12 | IC103.5 60.96,9.82 61.91,8.87 66.99,8.87 SV101.4
  Bottom 0.406: v44.77,64.12 IC101.6 | SV101.4 66.99,8.87 63.82,8.87 62.23,7.28 v46.35,7.28
N$1
  Bottom 0.406: IC105.1 30.8,13.32 34.29,16.81 55.56,16.81 56.52,15.86 IC104.1
N$2
  Bottom 0.406: IC105.4 23.18,11.09 23.81,10.46 53.34,10.46 53.98,11.09 IC104.2
N$3
  Bottom 0.61: R206.1 68.58,40.3 69.69,41.41 T201.2
N$4
  Bottom 0.61: R205.2 68.42,43.16 70.33,45.06 73.5,45.06 74.61,43.95 77.63,43.95 78.42,43.16 Q201.2
N$5
  Top 0.406: R108.1 20.64,28.24 21.27,28.87 24.77,28.87 25.4,28.24 25.4,25.06 27.3,23.16 OK101.3
N$7
  Bottom 0.61: R211.1 68.42,46.02 70.17,47.76 T202.2
N$9
  Top 0.406: R103.2 11.11,70.47 6.67,74.91 D101.AR
N$11  (via drill 0.5)
  Top 0.61: v10.48,25.06 20.32,25.06 22.54,27.29 R109.2
  Bottom 0.61: OK101.1 29.84,24.43 28.57,23.16 27.3,23.16 23.81,26.65 R109.2 | X101.3 3.11,8.93 1.91,10.14 1.91,19.35 3.17,20.62 9.84,20.62 10.48,21.25 v10.48,25.06
N$12
  Bottom 0.61: R212.2 67.94,49.03 70.8,51.89 76.36,51.89 78.42,49.83 Q203.2
N$13
  Top 0.406: R104.2 17.46,73.32 14.29,76.5 10.79,76.5 7.3,79.99 D101.AG
N$43
  Bottom 0.61: OK201.3 59.05,91.1 59.69,90.47 79.38,90.47 | 79.38,90.47 D202.A R207.1 | 79.38,90.47 D201.A
N$53
  Bottom 0.61: Q204.1 70.48,79.67 Q202.2 60.64,74.91 59.37,73.64 R209.2
N$54
  Top 0.61: Q204.2 70.48,78.09 Q202.3
  Bottom 0.61: Q202.3 71.75,73.01 71.12,72.37 63.18,72.37 62.23,71.42 R208.1
N$56
  Bottom 0.61: Q204.3 69.22,83.8 69.69,84.28 72.39,84.28 72.87,83.8 73.03,83.8 73.18,83.64 73.18,72.69 70.33,69.83 R210.1
N$57
  Top 0.61: R210.2 62.87,79.99 | OK201.2 61.59,91.1 62.87,89.83 62.87,79.99 | 62.87,79.99 R208.2
NC
  Bottom 1.016: JP302.16 JP301.15
PLUGGED  (via drill 0.5)
  Top 0.406: v10.48,73.01 15.24,73.01 16.19,72.05 30.8,72.05 31.75,73.01 36.83,73.01 v38.1,74.28
  Bottom 0.406: CON101.3 10.65,73.18 v10.48,73.01 | v38.1,74.28 IC101.39
ROT  (via drill 0.5)
  Top 0.61: D201.C 69.22,91.74 67.31,89.83 v67.31,86.02 67.31,84.91 67.94,84.28 72.55,84.28 72.87,83.96 81.12,83.96 82.55,85.39 X201.2
  Bottom 0.61: 67.31,76.81 60.96,76.81 59.37,78.4 R209.1 | Q202.1 67.31,76.81 | 67.31,76.81 v67.31,86.02
SCK  (via drill 0.5)
  Top 0.406: IC104.13 v43.81,8.24 43.81,10.14 42.55,11.41 42.55,13.95 43.81,15.22 v43.81,59.03 | IC103.6 v63.5,12.36
  Bottom 0.406: v43.81,59.03 IC101.8 | SV101.3 68.26,11.73 67.31,12.68 63.82,12.68 v63.5,12.36 59.37,8.24 v43.81,8.24
SCL
  Top 0.406: SV301.3 110.01,4.58 110.01,22.21 110.17,22.36 110.17,34.75 109.06,35.86 JP302.28
  Bottom 1.016: JP302.28 JP301.27
SDA
  Top 0.406: SV301.1 107.47,4.58 107.47,21.09 109.38,23 109.38,29.98 JP302.32
  Bottom 1.016: JP302.32 JP301.31
SPG  (via drill 0.5)
  Top 0.406: v46.67,67.92 v46.67,76.81
  Bottom 0.406: v46.67,67.92 30.16,67.92 R106.2 R107.1 | v46.67,76.81 IC101.40
STOP
  Top 0.406: SV301.5 112.55,4.58 112.55,16.33 110.97,17.92 110.97,40.14 110.17,40.94 JP302.24
  Bottom 1.016: JP302.24 JP301.23
STOP-I
  Bottom 0.61: IC101.25 56.67,38.71 56.83,38.87 71.12,38.87 T201.3
STOP-O
  Bottom 0.61: IC101.26 53.82,41.25 55.72,43.16 R205.1
TRACK  (via drill 0.5)
  Top 0.406: v40.01,78.09 40.01,43.79 40.01,39.83 38.89,38.71 IC101.16
  Bottom 0.406: v40.01,78.09 54.61,78.09 R213.2 59.05,82.53 OK201.6
V+  (via drill 0.5)
  Top 0.813: C105.1 31.75,84.75 29.84,86.66
  Top 1.27: V101.IN 29.84,86.34 29.84,86.66 D102.C 29.84,89.52 30.48,90.15 42.55,90.15 43.18,90.79 43.18,93.64 43.81,94.28 46.67,94.28 47.31,93.64 47.31,85.07 46.35,84.12 C104.+ 46.35,82.85 47.94,81.26 50.16,81.26 51.75,79.67 v51.75,76.81 v51.75,75.55 v51.75,74.28
  Bottom 1.27: C201.1 79.38,51.89 77.15,54.11 77.15,55.22 | IC201.IN 77.15,57.29 77.15,55.22 | 77.15,55.22 57.47,55.22 53.98,58.72 53.98,71.1 51.75,73.32 v51.75,74.28 v51.75,75.55 v51.75,76.81
V-NETZTEIL
  Top 1.27: D103.A 23.18,93.33 21.27,91.42 14.6,91.42 CON101.1

### Text on the board
Bottom: mbc89.brd | bottom | MBCAN-Projekt | 01.03.2022 | (c) Dr.-Ing. Th. Wiesner | (c) Dr.-Ing. Th. Wiesner | mbc89.brd | bottom
tNames: HW: 22.03.01 | I2C-Bus / Märklin Digital 1. Generation | 0 | B | +18V | DC | STATUS | sonstige MM-Zentralen | (c) Dr.-Ing. Th. Wiesner | MBCAN-Projekt | I2C-Bus Märklin Digital 1. Generation | IN | *) Bei Bedarf | BL | FL | (c) Dr.-Ing. Th. Wiesner | OUT | MBCAN-Projekt | 6021 | 6040/6043 | mbc-89